# Altium schematic sheet 02_Main_GaN_Buck.SchDoc
size B; SheetNumber: 2; SheetTotal: 2
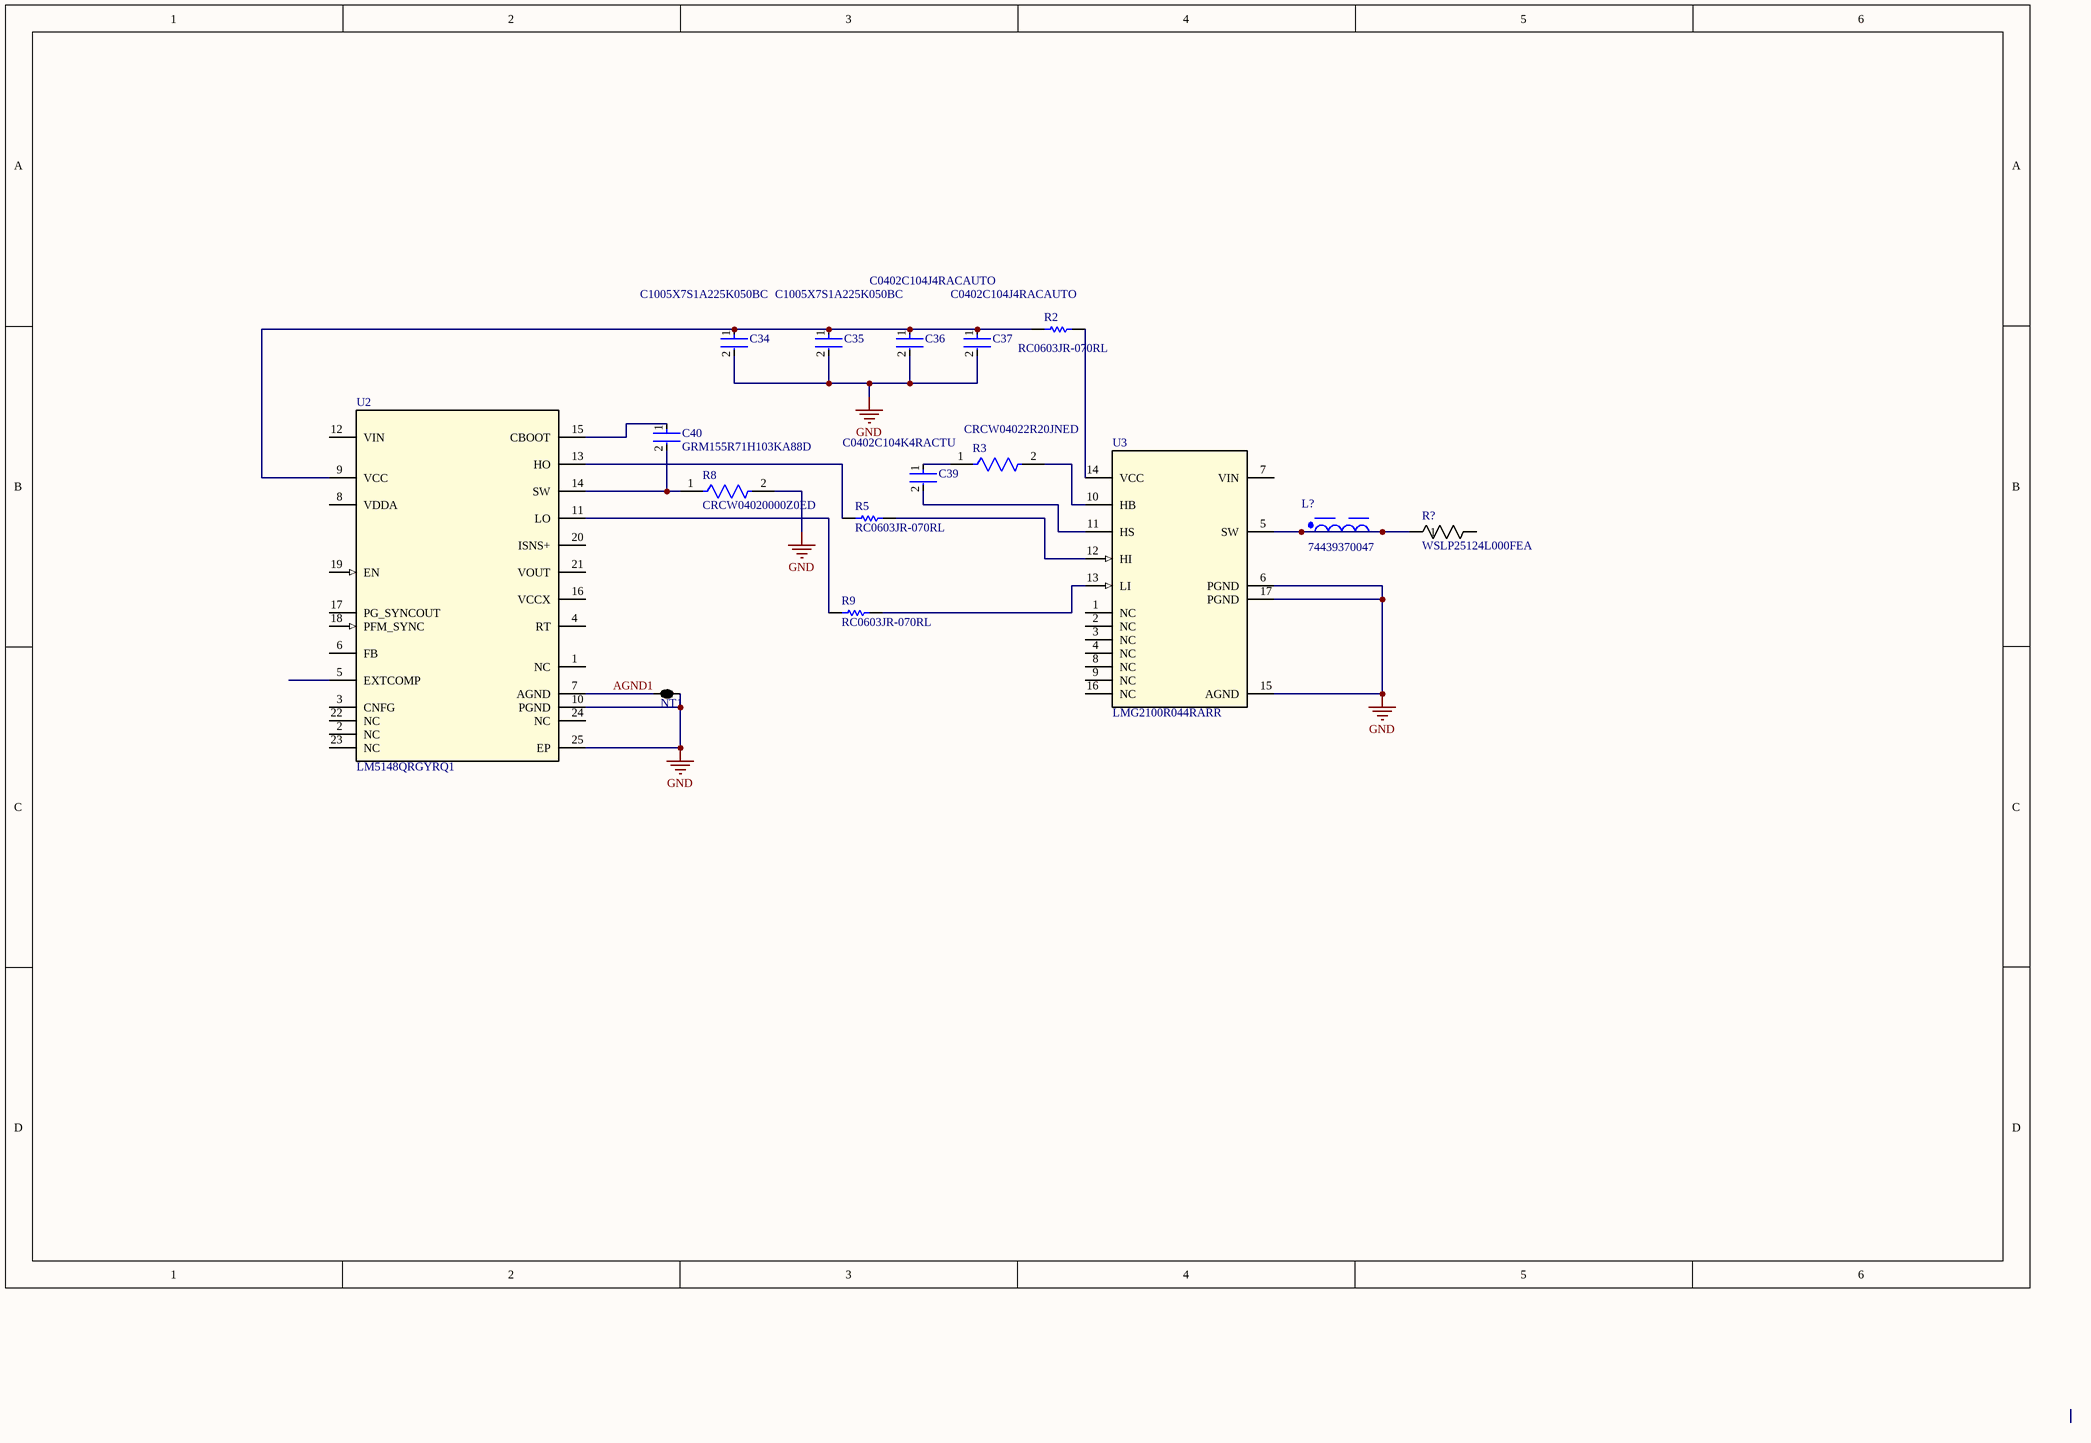
[diagram p0: 02_Main_GaN_Buck.SchDoc]

## Parts
C34  C1005X7S1A225K050BC  [FP-C1005-050-0_15-0_1-MFG]
C35  C1005X7S1A225K050BC  [FP-C1005-050-0_15-0_1-MFG]
C36  C0402C104J4RACAUTO  [FP-C0402-BB-MFG]
C37  C0402C104J4RACAUTO  [FP-C0402-BB-MFG]
C39  C0402C104K4RACTU  [FP-C0402-BB-MFG]
C40  GRM155R71H103KA88D  [FP-GRM155-0_05-IPC_C]
L?  74439370047  [WE-XHMI_1510]
NT1  2 way net tie junction  [2way_LP]  (value not drawn)  (net tie, no BOM)
R2  RC0603JR-070RL  [RESC1608X55X25ML10T15]
R3  CRCW04022R20JNED  [FP-CRCW0402-e3-IPC_C]
R5  RC0603JR-070RL  [RESC1608X55X25ML10T15]
R8  CRCW04020000Z0ED  [FP-CRCW0402-e3-IPC_C]
R9  RC0603JR-070RL  [RESC1608X55X25ML10T15]
R?  WSLP25124L000FEA  [RES_VISHAY_WSLP2512_A_VIS]
U2  LM5148QRGYRQ1  [RGY0024E-MFG]
U3  LMG2100R044RARR  [RAR0016B-MFG]

## Nets
GND: C34.2 C35.2 C36.2 C37.2 NT1.2 R8.2 U2.10(PGND) U2.25(EP) U3.6(PGND) U3.15(AGND) U3.17(PGND)
AGND1: NT1.1 U2.7(AGND)
NetC34_1: C34.1 C35.1 C36.1 C37.1 R2.1 U2.9(VCC)
NetC39_1: C39.1 R3.1
NetC39_2: C39.2 U3.11(HS)
NetC40_1: C40.1 U2.15(CBOOT)
NetC40_2: C40.2 R8.1 U2.14(SW)
NetL?_1: L?.1 L?.2 R?.1 U3.5(SW)
NetR2_2: R2.2 U3.14(VCC)
NetR3_2: R3.2 U3.10(HB)
NetR5_1: R5.1 U2.13(HO)
NetR5_2: R5.2 U3.12(HI)
NetR9_1: R9.1 U2.11(LO)
NetR9_2: R9.2 U3.13(LI)

Not connected (* = marked no-connect by the designer): R? 2; U2 1(NC) 2(NC) 3(CNFG) 4(RT) 5(EXTCOMP) 6(FB) 8(VDDA) 12(VIN) 16(VCCX) 17(PG_SYNCOUT) 18(PFM_SYNC) 19(EN) 20(ISNS+) 21(VOUT) 22(NC) 23(NC) 24(NC); U3 1(NC) 2(NC) 3(NC) 4(NC) 7(VIN) 8(NC) 9(NC) 16(NC)

## Library data of the parts
C34 C35 = CMP-08246-004344-1: CAP CER 2.2UF 10V X7S 0402; Dielectric Material: Ceramic; Tolerance: 10%; Mount: Surface Mount; Height: 0.5mm; Package Quantity: 1; Depth: 0.5mm; RoHS Compliant: Yes; Length: 1mm; Thickness: 0.022inch; Packaging: Tape and Reel; Capacitance: 2.2uF; Case Code (Imperial): 0402; Resistor Type: Ceramic; Dielectric: X7S; Case/Package: 0402; Min Operating Temperature: -55°C; Voltage Rating: 10V; Series: C; Weight: 2.3E-05oz; Width: 0.02inch; Voltage Rating (DC): 10V; Case Code (Metric): 1005; Max Operating Temperature: 125°C; Termination: SMD/SMT; Lead Free: Lead Free
C36 C37 = CMP-03020-012601-2: CAP CER SMD 0402 .1UF 5% X7R 16V; Manufacturer: Kemet; Capacitance: 0.10 μF; Tolerance: 0.05; Material: Ceramic; Temperature Coefficient: 15%; Value: 0.10 μF; ComponentLink2URL: https://content.kemet.com/datasheets/KEM_C1002_X7R_SMD.pdf; Temperature Characteristic: X7R; Lead Free: Yes; RoHS: TRUE; Mouser Description: Cap Ceramic 0.1uF 16V X7R 5% Pad SMD 0402 125C Automotive T/R; Height: 0.55mm; Device Class L1: Passive Components; Manufacturer Part Number: C0402C104J4RACAUTO; Package: C0402-BB; ComponentLink2Description: Datasheet; Temperature: -55°C to +125°C; Voltage Rating: 16 V; Digikey Description: CAP CER SMD 0402 .1UF 5% X7R 16V; Temperature Range High: +125°C; Automotive: No; Ipc Land Pattern Name: CAPC10050X50; Device Class L3: Ceramic Capacitors; Octopart: https://octopart.com/c0402c104j4racauto-kemet-87449057; Temperature Range Low: -55°C; Category: Cap; Device Class L2: Capacitors
C39 = CMP-2008-02108-2: CAP CER 0.1UF 16V X7R 0402; Manufacturer: Kemet; Value: 0.10 μF; Tolerance: 0.1; Material: Ceramic; Temperature Coefficient: 15%; Voltage Rating: 16 V; Package: C0402-BB; Automotive: No; Ipc Land Pattern Name: CAPC10050X50; Device Class L3: Ceramic Capacitors; Capacitance: 0.10 μF; Octopart: https://octopart.com/c0402c104k4ractu-kemet-94158; Temperature Characteristic: X7R; Mouser Description: Cap Ceramic 0.1uF 16V X7R 10% SMD 0402 125?C Paper T/R - Tape and Reel (Alt: C0402C104K4RAC TU); ComponentLink2Description: Datasheet; Temperature Range Low: -55°C; RoHS: TRUE; Device Class L1: Passive Components; Manufacturer Part Number: C0402C104K4RACTU; Temperature Range High: +125°C; Device Class L2: Capacitors; ComponentLink2URL: https://content.kemet.com/datasheets/KEM_C1002_X7R_SMD.pdf; Category: Cap; Height: 0.55mm; Temperature: -55°C to +125°C; Lead Free: Yes; Digikey Description: CAP CER 0.1UF 16V X7R 0402
C40 = CMP-2008-04637-5: Chip Multilayer Ceramic Capacitors for General Purpose, 0402, 10000pF, X7R, 15%, 10%, 50V; Voltage: 25V; Capacitance: 10nF; Tolerance: 10%; Mount: Surface Mount; Lead Free: Lead Free; Radiation Hardening: No; Case Code (Imperial): 0402; REACH SVHC: No SVHC; Case/Package: 0402; Dielectric: X7R; Voltage Rating (DC): 50V; Max Operating Temperature: 125°C; Termination: SMD/SMT; Material: Ceramic; Width: 0.02inch; Package Quantity: 1; Voltage Rating: 50V; Thickness: 0.022inch; Packaging: Tape and Reel; Height: 0.5mm; Number of Pins: 2; Case Code (Metric): 1005; Min Operating Temperature: -55°C; Length: 1mm; Depth: 0.5mm
L? = CMP-03913-75811210-2: Fixed Ind 4.7UH 17A 3.5MOHM SMD; Saturation Current: 20.9A; DC Resistance (DCR): 3.1mΩ; Inductance: 4.7µH; Inductance Tolerance: 20%; Ambient Temperature Range Low: -40°C; RMS Current (Irms): 17A; REACH SVHC: No; Length: 16.4mm; Max Operating Temperature: 125°C; Mount: Surface Mount; Current Rating: 17A; Number of Pins: 2; Width: 15.4mm; Min Operating Temperature: -40°C; Height: 10mm; Ambient Temperature Range High: 85°C; RoHS: Compliant
NT1 = 2way: ComponentLink1URL: http://www.edatools.cz/addons; ComponentLink1Description: Source; FootprintNote: LP=12mil, MP=40mil, HP=120mil
R2 R5 R9 = CMP-2100-03667-1: Chip Resistor, 0 Ohm, +/- 5%, 0.1 W, -55 to 155 degC, 0603 (1608 Metric), RoHS, Tape and Reel; Manufacturer: Yageo; Temperature Coefficient: 200ppm/degreesC; Voltage Rating: 50V; Power Rating: 100mW; Resistance: 0mOhm; Width: 0.8mm; Max Operating Temperature: 155degC; Tolerance: 5%; Package Reference: 0603; Height: 0.45mm; Depth: 0.8mm; Package Description: 2-Pin Surface Mount Device, Body 1.6 x 0.8 mm; Termination: SMD/SMT; Package Quantity: 5000; Case/Package: 0603; Case Code (Imperial): 0603; Radiation Hardening: No; Number of Pins: 2; Length: 1.6mm; Lead Free: LeadFree; Voltage Rating (DC): 50V; Military Standard: Not; Datasheet URL: http://www.yageo.com/NewPortal/yageodocoutput?fileName=/pdf/R-Chip/PYu-RC_Group_51_RoHS_L_5.pdf; Manufacturer URL: http://www.yageo.com/; Packaging: TapeandReel; Case Code (Metric): 1608; Min Operating Temperature: -55degC; Composition: ThickFilm; RoHSCompliant: true; Contact Plating: Tin; Datasheet Version: Rev. 5, 10/2016; REACH SVHC: NoSVHC
R3 = CMP-2002-08490-2: RES Thick Film, 2.2Ω, 5%, 0.063W, 200ppm/°C, 0402; Voltage Rating: 50V; Resistance: 2.2R; Power Rating: 63mW; Weight: 2.3E-05oz; Case/Package: 0402; Temperature Coefficient: 200ppm/°C; Number of Pins: 2; Width: 0.5mm; Min Operating Temperature: -55°C; Military Standard: Not; Termination: SMD/SMT; Depth: 0.5mm; Composition: Thick Film; Case Code (Metric): 1005; Radiation Hardening: No; Length: 1mm; Height: 0.35mm; Package Quantity: 10000; Lead Free: Lead Free; Max Operating Temperature: 155°C; Packaging: Tape and Reel; Tolerance: 5%; Case Code (Imperial): 0402; Contact Plating: Tin; Voltage Rating (DC): 50V
R8 = CMP-2002-08122-2: RES Thick Film, 0Ω, 0.063W, 0402; Tolerance: 5%; Max Power Dissipation: 63mW; Voltage Rating: 50V; Temperature Coefficient: 100ppm/°C; Resistance: 0mR; Contact Plating: Tin; Height: 0.35mm; Radiation Hardening: No; Features: Automotive AEC-Q200; Composition: Thick Film; Width: 0.5mm; Weight: 2.3E-05oz; Termination: SMD/SMT; Packaging: Tape and Reel; Mount: Surface Mount; Case Code (Metric): 1005; Military Standard: Not; Min Operating Temperature: -55°C; Number of Terminations: 2; Package Quantity: 1; Case Code (Imperial): 0402; Depth: 0.5mm; Max Operating Temperature: 155°C; Case/Package: 0402; Power Rating: 63mW; Lead Free: Lead Free; Voltage Rating (DC): 50V; Length: 1mm
R? = WSLP25124L000FEA: WSLP2512 .004 1% EA e3; Manufacturer_Name: Vishay; Copyright: Copyright (C) 2026 Ultra Librarian. All rights reserved.; Manufacturer_Part_Number: WSLP25124L000FEA
U2 = LM5148QRGYRQ1: Automotive, 80V synchronous buck DC/DC controller with ultra-low I<sub>Q</sub> 24-VQFN -40 to 125; Manufacturer_Name: Texas Instruments; TYPE: TYPE; RefDes: RefDes; Copyright: Copyright (C) 2025 Ultra Librarian. All rights reserved.; Manufacturer_Part_Number: LM5148QRGYRQ1
U3 = LMG2100R044RARR: 100-V 4.4-mâ„¦ half-bridge GaN FET with integrated driver and protection 16-VQFN-FCRLF -40 to 125; Manufacturer_Name: Texas Instruments; TYPE: TYPE; RefDes: RefDes; Copyright: Copyright (C) 2026 Ultra Librarian. All rights reserved.; Manufacturer_Part_Number: LMG2100R044RARR